# Altium schematic sheet Schematic1_4.SchDoc
size 594 x 420 mm; SchematicName: Schematic1; PageName: 4; CmpIndex: 977; Symbol name: A2-LIST-2N-1-GA.1; SymIndex: 3
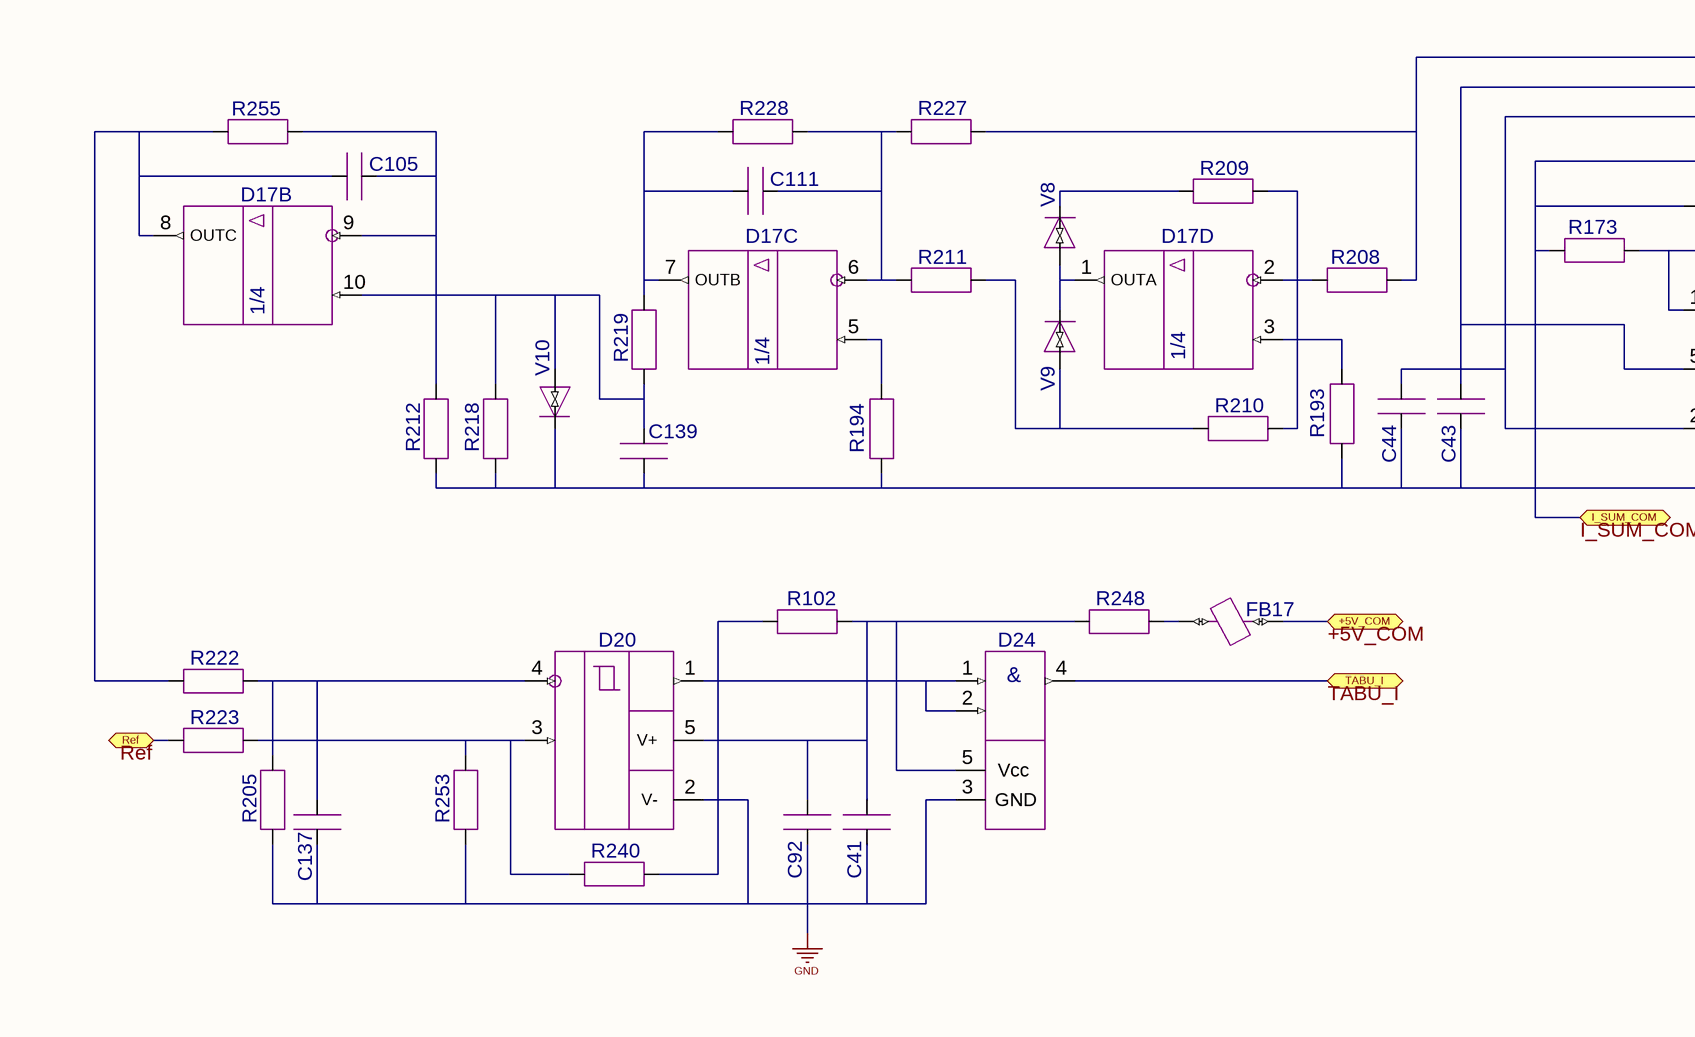
[diagram p0: Schematic1_4.SchDoc, top left]
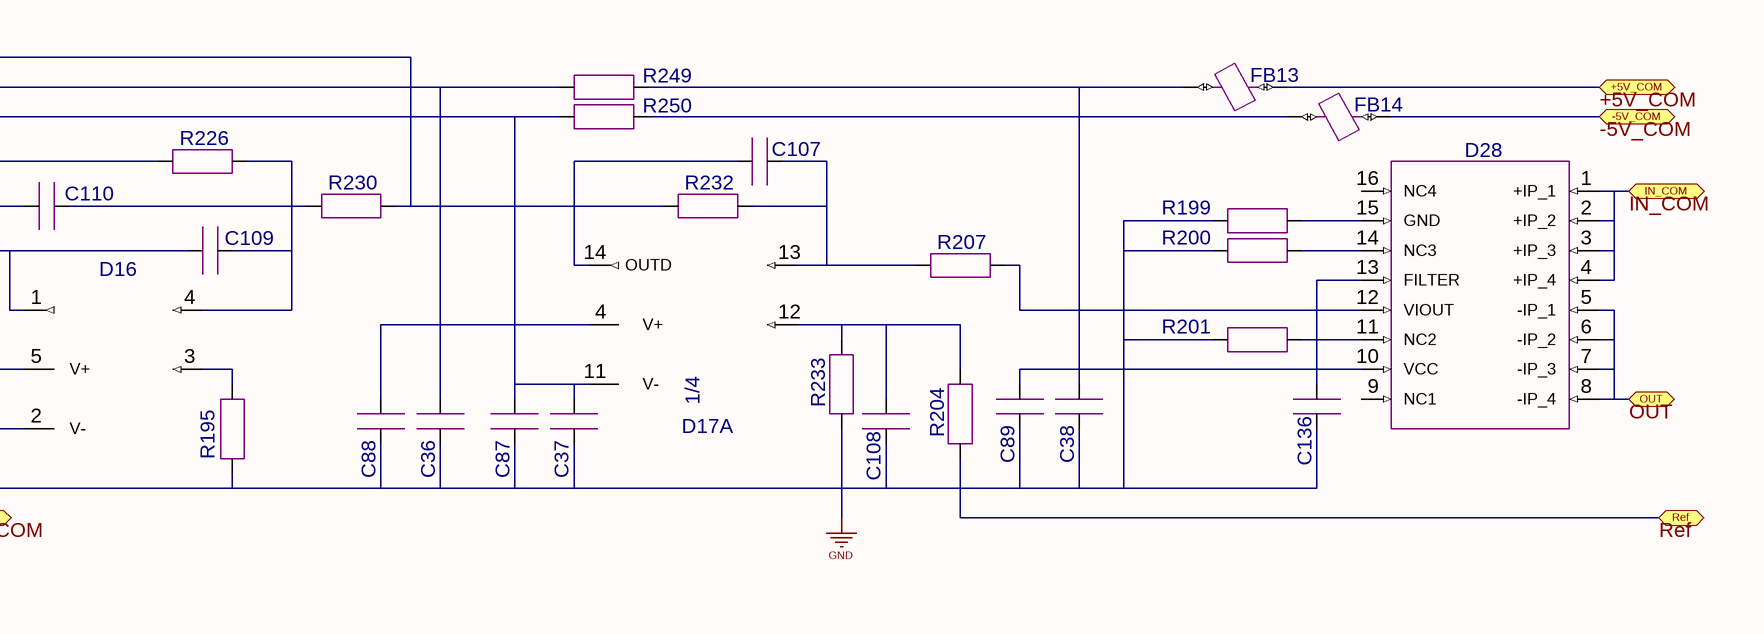
[diagram p1: Schematic1_4.SchDoc, top right]
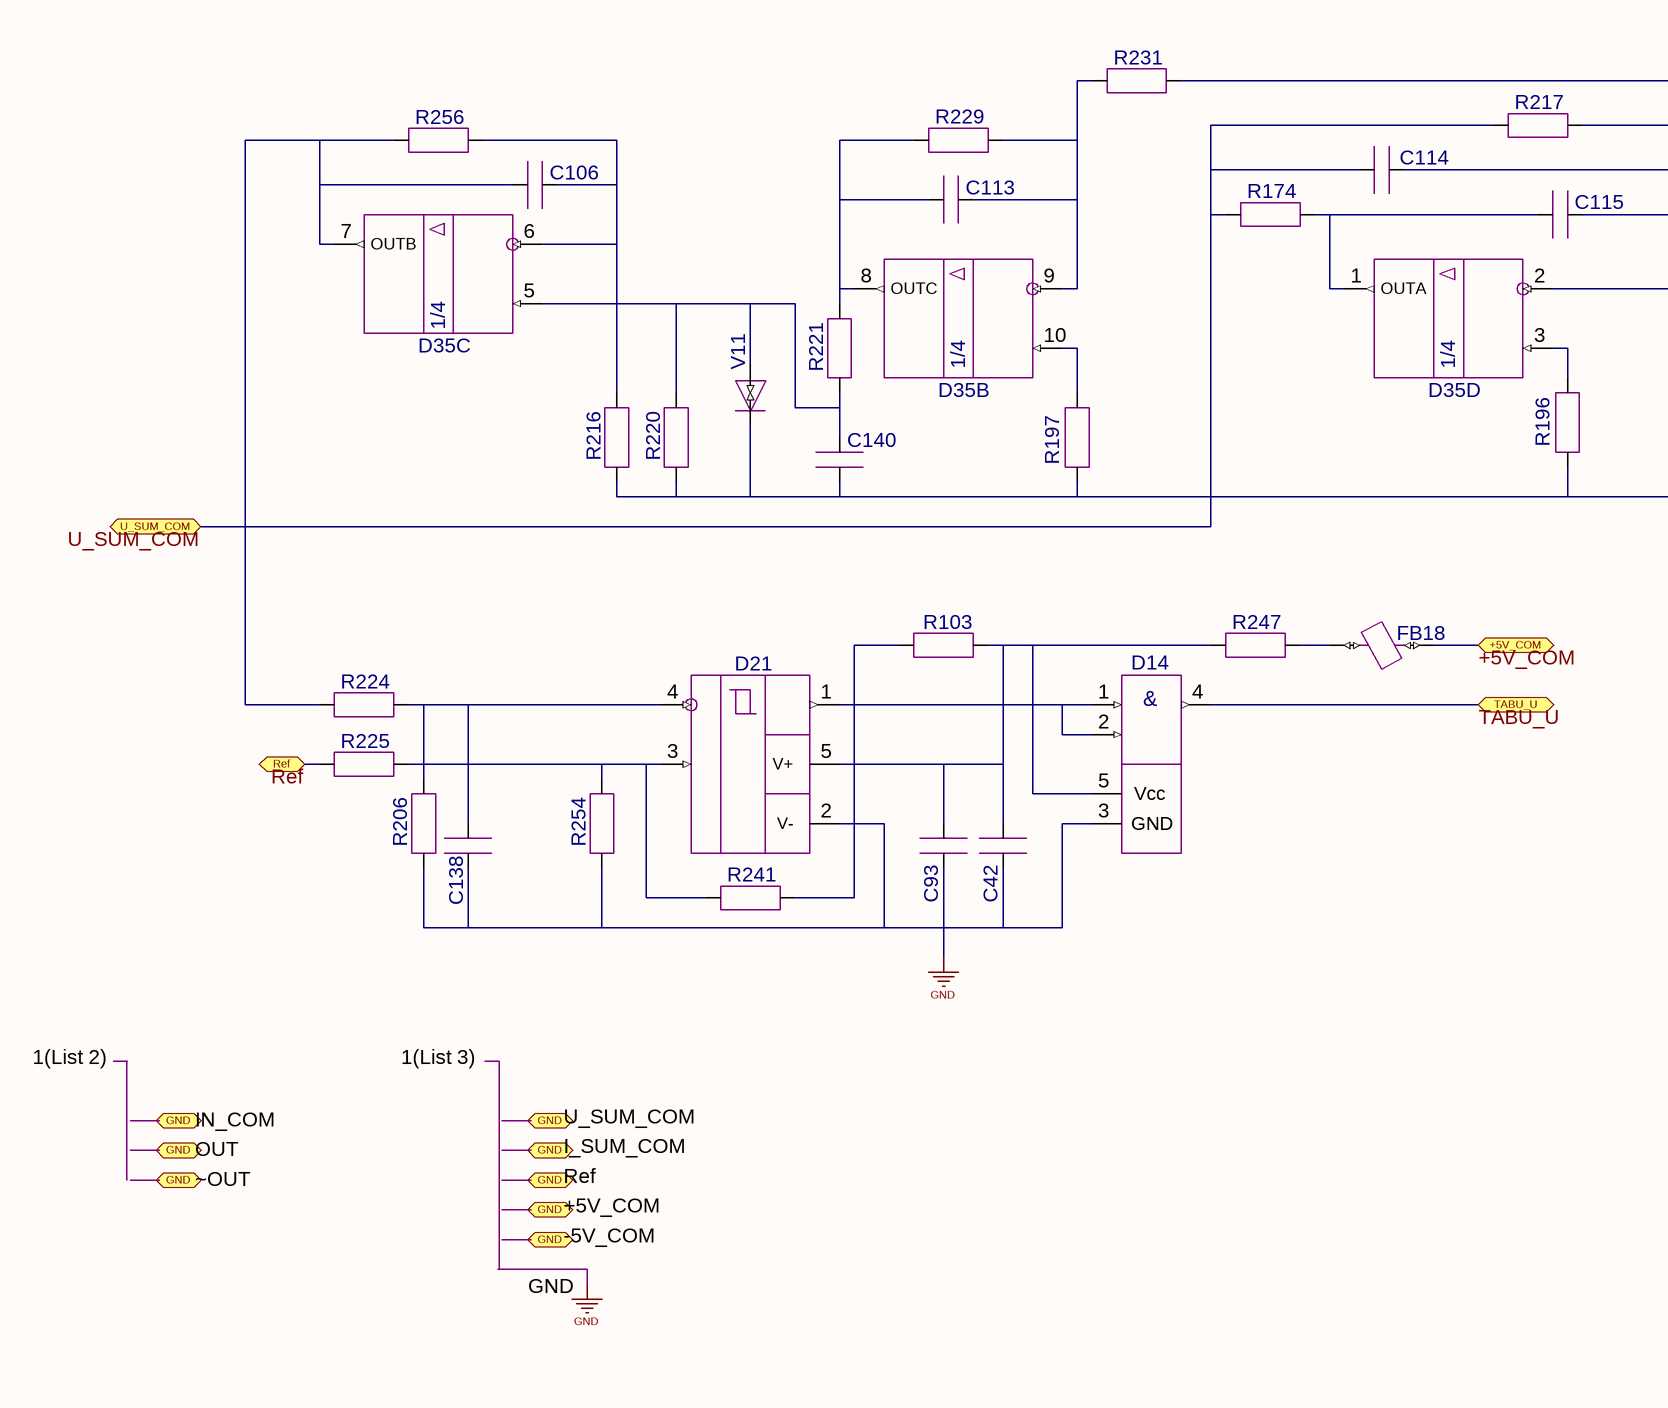
[diagram p2: Schematic1_4.SchDoc, bottom left]
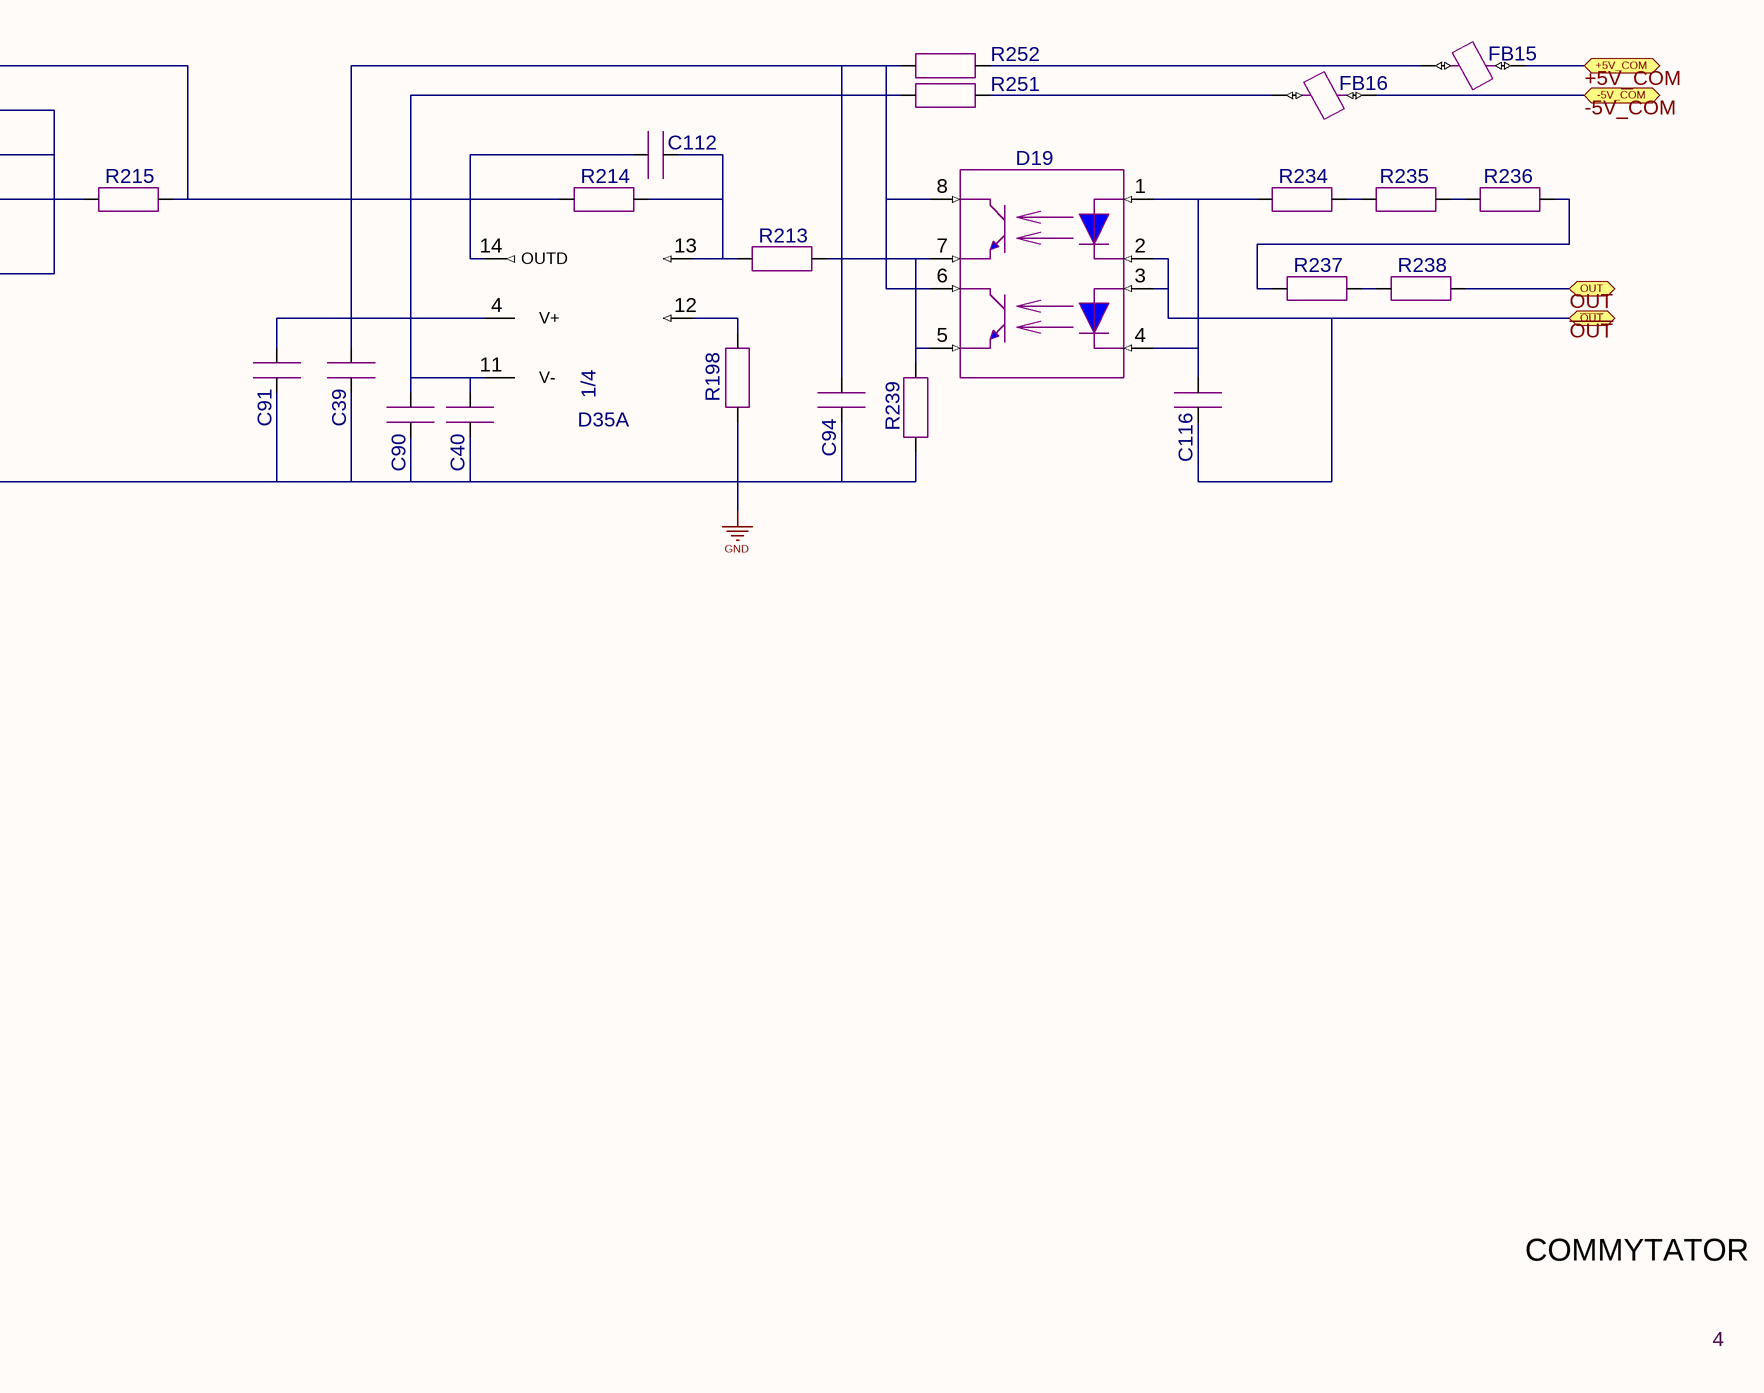
[diagram p3: Schematic1_4.SchDoc, bottom right]

## Parts
C36  CAP CER 0.1UF 50V 10% X7R 0603  (value not drawn)
C37  CAP CER 0.1UF 50V 10% X7R 0603  (value not drawn)
C38  CAP CER 0.1UF 50V 10% X7R 0603  (value not drawn)
C39  CAP CER 0.1UF 50V 10% X7R 0603  (value not drawn)
C40  CAP CER 0.1UF 50V 10% X7R 0603  (value not drawn)
C41  CAP CER 0.1UF 50V 10% X7R 0603  (value not drawn)
C42  CAP CER 0.1UF 50V 10% X7R 0603  (value not drawn)
C43  CAP CER 0.1UF 50V 10% X7R 0603  (value not drawn)
C44  CAP CER 0.1UF 50V 10% X7R 0603  (value not drawn)
C87  CAP CER 10UF 16V 10% X7R 0805  (value not drawn)
C88  CAP CER 10UF 16V 10% X7R 0805  (value not drawn)
C89  CAP CER 10UF 16V 10% X7R 0805  (value not drawn)
C90  CAP CER 10UF 16V 10% X7R 0805  (value not drawn)
C91  CAP CER 10UF 16V 10% X7R 0805  (value not drawn)
C92  CAP CER 10UF 16V 10% X7R 0805  (value not drawn)
C93  CAP CER 10UF 16V 10% X7R 0805  (value not drawn)
C94  CAP CER 10UF 16V 10% X7R 0805  (value not drawn)
C105  CAP CER 10PF 50V 5% NP0 0603  (value not drawn)
C106  CAP CER 10PF 50V 5% NP0 0603  (value not drawn)
C107  CAP CER 1PF 50V C0G/NP0 0603  (value not drawn)
C108  CAP CER 1PF 50V C0G/NP0 0603  (value not drawn)
C109  CAP CER 1PF 50V C0G/NP0 0603  (value not drawn)
C110  CAP CER 1PF 50V C0G/NP0 0603  (value not drawn)
C111  CAP CER 1PF 50V C0G/NP0 0603  (value not drawn)
C112  CAP CER 1PF 50V C0G/NP0 0603  (value not drawn)
C113  CAP CER 1PF 50V C0G/NP0 0603  (value not drawn)
C114  CAP CER 1PF 50V C0G/NP0 0603  (value not drawn)
C115  CAP CER 1PF 50V C0G/NP0 0603  (value not drawn)
C116  CAP CER 1PF 50V C0G/NP0 0603  (value not drawn)
C136  CAP CER 1000PF 50V 5% NP0 0603  (value not drawn)
C137  CAP CER 1000PF 50V 5% NP0 0603  (value not drawn)
C138  CAP CER 1000PF 50V 5% NP0 0603  (value not drawn)
C139  CAP CER 8200PF 50V 10% X7R 0805  (value not drawn)
C140  CAP CER 8200PF 50V 10% X7R 0805  (value not drawn)
D14  IC GATE AND 1CH 2-INP SOT-23-5  (value not drawn)
D16  IC OPAMP VFB 130MHZ RRO SOT23-5  (value not drawn)
D17  IC OPAMP VFB 130MHZ RRO 14SOIC  (value not drawn)  (parts A,B,C,D of 4)
D19  OPTOISO 2.5KV 2CH TRANS 8SOIC  (value not drawn)
D20  IC COMPARATR NANOPWR P-P SOT23-5  (value not drawn)
D21  IC COMPARATR NANOPWR P-P SOT23-5  (value not drawn)
D24  IC GATE NAND 1CH 2-INP SOT-23-5  (value not drawn)
D28  HALL EFFECT CURRENT SENSRO  (value not drawn)
D35  IC OPAMP VFB 130MHZ RRO 14SOIC  (value not drawn)  (parts A,B,C,D of 4)
FB13  FERRITE BEAD 1800 OHM 0,2 A 0603  (value not drawn)
FB14  FERRITE BEAD 1800 OHM 0,2 A 0603  (value not drawn)
FB15  FERRITE BEAD 1800 OHM 0,2 A 0603  (value not drawn)
FB16  FERRITE BEAD 1800 OHM 0,2 A 0603  (value not drawn)
FB17  FERRITE BEAD 1800 OHM 0,2 A 0603  (value not drawn)
FB18  FERRITE BEAD 1800 OHM 0,2 A 0603  (value not drawn)
R102  RES 4.70K OHM 1/10W 1% 0603 SMD  (value not drawn)
R103  RES 4.70K OHM 1/10W 1% 0603 SMD  (value not drawn)
R173  RES 200 OHM 1/10W 1% 0603 SMD  (value not drawn)
R174  RES 200 OHM 1/10W 1% 0603 SMD  (value not drawn)
R193  RES 0.0 OHM 1/10W 0603 SMD  (value not drawn)
R194  RES 0.0 OHM 1/10W 0603 SMD  (value not drawn)
R195  RES 0.0 OHM 1/10W 0603 SMD  (value not drawn)
R196  RES 0.0 OHM 1/10W 0603 SMD  (value not drawn)
R197  RES 0.0 OHM 1/10W 0603 SMD  (value not drawn)
R198  RES 0.0 OHM 1/10W 0603 SMD  (value not drawn)
R199  RES 0.0 OHM 1/10W 0603 SMD  (value not drawn)
R200  RES 0.0 OHM 1/10W 0603 SMD  (value not drawn)
R201  RES 0.0 OHM 1/10W 0603 SMD  (value not drawn)
R204  RES 10.7 OHM 1/10W 1% 0603 SMD  (value not drawn)
R205  RES 10.7 OHM 1/10W 1% 0603 SMD  (value not drawn)
R206  RES 10.7 OHM 1/10W 1% 0603 SMD  (value not drawn)
R207  RES 10.2K OHM 1/10W 1% 0603 SMD  (value not drawn)
R208  RES 10.2K OHM 1/10W 1% 0603 SMD  (value not drawn)
R209  RES 10.2K OHM 1/10W 1% 0603 SMD  (value not drawn)
R210  RES 10.2K OHM 1/10W 1% 0603 SMD  (value not drawn)
R211  RES 10.2K OHM 1/10W 1% 0603 SMD  (value not drawn)
R212  RES 10.2K OHM 1/10W 1% 0603 SMD  (value not drawn)
R213  RES 10.2K OHM 1/10W 1% 0603 SMD  (value not drawn)
R214  RES 10.2K OHM 1/10W 1% 0603 SMD  (value not drawn)
R215  RES 10.2K OHM 1/10W 1% 0603 SMD  (value not drawn)
R216  RES 10.2K OHM 1/10W 1% 0603 SMD  (value not drawn)
R217  RES 10.2K OHM 1/10W 1% 0603 SMD  (value not drawn)
R218  RES 10.2K OHM 1/10W 1% 0603 SMD  (value not drawn)
R219  RES 10.2K OHM 1/10W 1% 0603 SMD  (value not drawn)
R220  RES 10.2K OHM 1/10W 1% 0603 SMD  (value not drawn)
R221  RES 10.2K OHM 1/10W 1% 0603 SMD  (value not drawn)
R222  RES 10.2K OHM 1/10W 1% 0603 SMD  (value not drawn)
R223  RES 10.2K OHM 1/10W 1% 0603 SMD  (value not drawn)
R224  RES 10.2K OHM 1/10W 1% 0603 SMD  (value not drawn)
R225  RES 10.2K OHM 1/10W 1% 0603 SMD  (value not drawn)
R226  RES 20.5K OHM 1/10W 1% 0603 SMD  (value not drawn)
R227  RES 20.5K OHM 1/10W 1% 0603 SMD  (value not drawn)
R228  RES 20.5K OHM 1/10W 1% 0603 SMD  (value not drawn)
R229  RES 20.5K OHM 1/10W 1% 0603 SMD  (value not drawn)
R230  RES 20.5K OHM 1/10W 1% 0603 SMD  (value not drawn)
R231  RES 20.5K OHM 1/10W 1% 0603 SMD  (value not drawn)
R232  RES 20.5K OHM 1/10W 1% 0603 SMD  (value not drawn)
R233  RES 20.5K OHM 1/10W 1% 0603 SMD  (value not drawn)
R234  RES 22.0K OHM 1W 5% 2512 SMD  (value not drawn)
R235  RES 22.0K OHM 1W 5% 2512 SMD  (value not drawn)
R236  RES 22.0K OHM 1W 5% 2512 SMD  (value not drawn)
R237  RES 22.0K OHM 1W 5% 2512 SMD  (value not drawn)
R238  RES 22.0K OHM 1W 5% 2512 SMD  (value not drawn)
R239  RES 51.1 OHM 1/2W 1% 1210 SMD  (value not drawn)
R240  RES 340K OHM 1/10W 1% 0603 SMD  (value not drawn)
R241  RES 340K OHM 1/10W 1% 0603 SMD  (value not drawn)
R247  RES 10.0 OHM 1/10W 1% 0603 SMD  (value not drawn)
R248  RES 10.0 OHM 1/10W 1% 0603 SMD  (value not drawn)
R249  RES 10.0 OHM 1/10W 1% 0603 SMD  (value not drawn)
R250  RES 10.0 OHM 1/10W 1% 0603 SMD  (value not drawn)
R251  RES 10.0 OHM 1/10W 1% 0603 SMD  (value not drawn)
R252  RES 10.0 OHM 1/10W 1% 0603 SMD  (value not drawn)
R253  RES 210 OHM 1/10W 1% 0603 SMD  (value not drawn)
R254  RES 210 OHM 1/10W 1% 0603 SMD  (value not drawn)
R255  RES 53.6K OHM 1/10W 1% 0603 SMD  (value not drawn)
R256  RES 53.6K OHM 1/10W 1% 0603 SMD  (value not drawn)
V8  DIODE SWITCH 100V 0.15A SOD123  (value not drawn)
V9  DIODE SWITCH 100V 0.15A SOD123  (value not drawn)
V10  DIODE SWITCH 100V 0.15A SOD123  (value not drawn)
V11  DIODE SWITCH 100V 0.15A SOD123  (value not drawn)

## Ports
+5V_COM, -5V_COM, GND, I_SUM_COM, IN_COM, OUT, Ref, TABU_I, TABU_U, U_SUM_COM, ~{OUT}

## Nets
GND: C36.1 C37.1 C38.1 C39.1 C40.1 C41.1 C42.1 C43.1 C44.1 C87.2 C88.2 C89.2 C90.2 C91.2 C92.2 C93.2 C94.2 C108.1 C136.2 C137.2 C138.2 C139.1 C140.1 D14.3(GND) D20.2(V-) D21.2(V-) D24.3(GND) R193.2 R194.2 R195.2 R196.2 R197.2 R198.2 R199.2 R200.2 R201.2 R205.1 R206.1 R212.1 R216.1 R218.1 R220.1 R233.1 R239.1 R253.1 R254.1 V10.1(C) V11.1(C)
+5V_COM: FB13.1 FB15.1 FB17.1 FB18.1 ; port +5V_COM
-5V_COM: FB14.1 FB16.1 ; port -5V_COM
I_SUM_COM: C110.2 R173.1 R226.1 ; port I_SUM_COM
IN_COM: D28.1(+IP_1) D28.2(+IP_2) D28.3(+IP_3) D28.4(+IP_4) ; port IN_COM
~{OUT}: C116.2 D19.2(C1) D19.3(A2) ; port ~{OUT}
OUT: D28.5(-IP_1) D28.6(-IP_2) D28.7(-IP_3) D28.8(-IP_4) R238.2 ; port OUT
Ref: R204.1 R223.1 R225.1 ; port Ref
TABU_I: D24.4(Y) ; port TABU_I
TABU_U: D14.4(Y) ; port TABU_U
U_SUM_COM: C114.2 R174.1 R217.1 ; port U_SUM_COM
NetC36_2: C36.2 C43.2 C88.1 D16.5(V+) D17.4(V+) R249.1
NetC37_2: C37.2 C44.2 C87.1 D16.2(V-) D17.11(V-) R250.1
NetC38_2: C38.2 C89.1 D28.10(VCC) FB13.2 R249.2
NetC39_2: C39.2 C91.1 C94.1 D19.6(C3) D19.8(C4) D35.4(V+) R252.1
NetC40_2: C40.2 C90.1 D35.11(V-) R251.1
NetC41_2: C41.2 C92.1 D20.5(V+) D24.5(Vcc) R102.2 R248.1
NetC42_2: C42.2 C93.1 D14.5(Vcc) D21.5(V+) R103.2 R247.1
NetC105_1: C105.1 D17.9(-INC) R212.2 R255.2
NetC105_2: C105.2 D17.8(OUTC) R222.1 R255.1
NetC106_1: C106.1 D35.6(-INB) R216.2 R256.2
NetC106_2: C106.2 D35.7(OUTB) R224.1 R256.1
NetC107_1: C107.1 D17.13(-IND) R207.1 R232.2
NetC107_2: C107.2 D17.14(OUTD) R208.2 R227.2 R230.2 R232.1
NetC108_2: C108.2 D17.12(+IND) R204.2 R233.2
NetC109_1: C109.1 C110.1 D16.4(-IN) R226.2 R230.1
NetC109_2: C109.2 D16.1(OUT) R173.2
NetC111_1: C111.1 D17.6(-INB) R211.1 R227.1 R228.2
NetC111_2: C111.2 D17.7(OUTB) R219.2 R228.1
NetC112_1: C112.1 D35.13(-IND) R213.1 R214.2
NetC112_2: C112.2 D35.14(OUTD) R214.1 R215.2 R231.2
NetC113_1: C113.1 D35.9(-INC) R229.2 R231.1
NetC113_2: C113.2 D35.8(OUTC) R221.2 R229.1
NetC114_1: C114.1 C115.1 D35.2(-INA) R215.1 R217.2
NetC115_2: C115.2 D35.1(OUTA) R174.2
NetC116_1: C116.1 D19.1(A1) D19.4(C2) R234.1
NetC136_1: C136.1 D28.13(FILTER)
NetC137_1: C137.1 D20.4(-IN) R205.2 R222.2
NetC138_1: C138.1 D21.4(-IN) R206.2 R224.2
NetC139_2: C139.2 D17.10(+INC) R218.2 R219.1 V10.2(A)
NetC140_2: C140.2 D35.5(+INB) R220.2 R221.1 V11.2(A)
NetD14_1: D14.1(A) D14.2(B) D21.1(OUT) R103.1 R241.2
NetD16_3: D16.3(+IN) R195.1
NetD17_1: D17.1(OUTA) V8.2(A) V9.1(C)
NetD17_2: D17.2(-INA) R208.1 R209.2 R210.2
NetD17_3: D17.3(+INA) R193.1
NetD17_5: D17.5(+INB) R194.1
NetD19_5: D19.5(A3) D19.7(A4) R213.2 R239.2
NetD20_1: D20.1(OUT) D24.1(A) D24.2(B) R102.1 R240.2
NetD20_3: D20.3(+IN) R223.2 R240.1 R253.2
NetD21_3: D21.3(+IN) R225.2 R241.1 R254.2
NetD28_11: D28.11(NC2) R201.1
NetD28_12: D28.12(VIOUT) R207.2
NetD28_14: D28.14(NC3) R200.1
NetD28_15: D28.15(GND) R199.1
NetD35_3: D35.3(+INA) R196.1
NetD35_10: D35.10(+INC) R197.1
NetD35_12: D35.12(+IND) R198.1
NetFB14_2: FB14.2 R250.2
NetFB15_2: FB15.2 R252.2
NetFB16_2: FB16.2 R251.2
NetFB17_2: FB17.2 R248.2
NetFB18_2: FB18.2 R247.2
NetR209_1: R209.1 V8.1(C)
NetR210_1: R210.1 R211.2 V9.2(A)
NetR234_2: R234.2 R235.1
NetR235_2: R235.2 R236.1
NetR236_2: R236.2 R237.1
NetR237_2: R237.2 R238.1

Not connected (* = marked no-connect by the designer): D28 9(NC1) 16(NC4)

## Notes on the sheet
- 1(List 2)
- 1(List 3)
- IN_COM
- U_SUM_COM
- OUT
- ~OUT
- +5V_COM
- I_SUM_COM
- Ref
- GND
- -5V_COM
- COMMYTATOR
- 4
- Labels drawn without touching a wire or pin: GND
- (in symbol IC GATE AND 1CH 2-INP SOT-23-5) &
- (in symbol IC GATE NAND 1CH 2-INP SOT-23-5) &
- (in symbol IC OPAMP VFB 130MHZ RRO 14SOIC, part A) 1/4
- (in symbol IC OPAMP VFB 130MHZ RRO 14SOIC, part B) 1/4
- (in symbol IC OPAMP VFB 130MHZ RRO 14SOIC, part C) 1/4
- (in symbol IC OPAMP VFB 130MHZ RRO 14SOIC, part D) 1/4

## Library data of the parts
C36 = CAP CER 0.1UF 50V 10% X7R 0603: CL10B104KB8SFNC; Part Label: 100nF VIP; Cell Name: 0603-STANDART-1608; CmpIndex: 285; Ref Designator: C36; Symbol name: C-SXEM-1.1; SymIndex: 6; Part Name: CAP CER 0.1UF 50V 10% X7R 0603; Part Number: CL10B104KB8SFNC
C37 = CAP CER 0.1UF 50V 10% X7R 0603: CL10B104KB8SFNC; Part Label: 100nF VIP; Cell Name: 0603-STANDART-1608; CmpIndex: 286; Ref Designator: C37; Symbol name: C-SXEM-1.1; SymIndex: 6; Part Name: CAP CER 0.1UF 50V 10% X7R 0603; Part Number: CL10B104KB8SFNC
C38 = CAP CER 0.1UF 50V 10% X7R 0603: CL10B104KB8SFNC; Part Label: 100nF VIP; Cell Name: 0603-STANDART-1608; CmpIndex: 289; Ref Designator: C38; Symbol name: C-SXEM-1.1; SymIndex: 6; Part Name: CAP CER 0.1UF 50V 10% X7R 0603; Part Number: CL10B104KB8SFNC
C39 = CAP CER 0.1UF 50V 10% X7R 0603: CL10B104KB8SFNC; Part Label: 100nF VIP; Cell Name: 0603-STANDART-1608; CmpIndex: 335; Ref Designator: C39; Symbol name: C-SXEM-1.1; SymIndex: 6; Part Name: CAP CER 0.1UF 50V 10% X7R 0603; Part Number: CL10B104KB8SFNC
C40 = CAP CER 0.1UF 50V 10% X7R 0603: CL10B104KB8SFNC; Part Label: 100nF VIP; Cell Name: 0603-STANDART-1608; CmpIndex: 336; Ref Designator: C40; Symbol name: C-SXEM-1.1; SymIndex: 6; Part Name: CAP CER 0.1UF 50V 10% X7R 0603; Part Number: CL10B104KB8SFNC
C41 = CAP CER 0.1UF 50V 10% X7R 0603: CL10B104KB8SFNC; Part Label: 100nF VIP; Cell Name: 0603-STANDART-1608; CmpIndex: 384; Ref Designator: C41; Symbol name: C-SXEM-1.1; SymIndex: 6; Part Name: CAP CER 0.1UF 50V 10% X7R 0603; Part Number: CL10B104KB8SFNC
C42 = CAP CER 0.1UF 50V 10% X7R 0603: CL10B104KB8SFNC; Part Label: 100nF VIP; Cell Name: 0603-STANDART-1608; CmpIndex: 395; Ref Designator: C42; Symbol name: C-SXEM-1.1; SymIndex: 6; Part Name: CAP CER 0.1UF 50V 10% X7R 0603; Part Number: CL10B104KB8SFNC
C43 = CAP CER 0.1UF 50V 10% X7R 0603: CL10B104KB8SFNC; Part Label: 100nF VIP; Cell Name: 0603-STANDART-1608; CmpIndex: 307; Ref Designator: C43; Symbol name: C-SXEM-1.1; SymIndex: 6; Part Name: CAP CER 0.1UF 50V 10% X7R 0603; Part Number: CL10B104KB8SFNC
C44 = CAP CER 0.1UF 50V 10% X7R 0603: CL10B104KB8SFNC; Part Label: 100nF VIP; Cell Name: 0603-STANDART-1608; CmpIndex: 332; Ref Designator: C44; Symbol name: C-SXEM-1.1; SymIndex: 6; Part Name: CAP CER 0.1UF 50V 10% X7R 0603; Part Number: CL10B104KB8SFNC
C87 = CAP CER 10UF 16V 10% X7R 0805: CL21B106KOQNNNE; Part Label: 10uF VIP; Cell Name: 0805-STANDART-2012; CmpIndex: 287; Ref Designator: C87; Symbol name: C-SXEM-1.1; SymIndex: 6; Part Name: CAP CER 10UF 16V 10% X7R 0805; Part Number: CL21B106KOQNNNE
C88 = CAP CER 10UF 16V 10% X7R 0805: CL21B106KOQNNNE; Part Label: 10uF VIP; Cell Name: 0805-STANDART-2012; CmpIndex: 288; Ref Designator: C88; Symbol name: C-SXEM-1.1; SymIndex: 6; Part Name: CAP CER 10UF 16V 10% X7R 0805; Part Number: CL21B106KOQNNNE
C89 = CAP CER 10UF 16V 10% X7R 0805: CL21B106KOQNNNE; Part Label: 10uF VIP; Cell Name: 0805-STANDART-2012; CmpIndex: 290; Ref Designator: C89; Symbol name: C-SXEM-1.1; SymIndex: 6; Part Name: CAP CER 10UF 16V 10% X7R 0805; Part Number: CL21B106KOQNNNE
C90 = CAP CER 10UF 16V 10% X7R 0805: CL21B106KOQNNNE; Part Label: 10uF VIP; Cell Name: 0805-STANDART-2012; CmpIndex: 337; Ref Designator: C90; Symbol name: C-SXEM-1.1; SymIndex: 6; Part Name: CAP CER 10UF 16V 10% X7R 0805; Part Number: CL21B106KOQNNNE
C91 = CAP CER 10UF 16V 10% X7R 0805: CL21B106KOQNNNE; Part Label: 10uF VIP; Cell Name: 0805-STANDART-2012; CmpIndex: 338; Ref Designator: C91; Symbol name: C-SXEM-1.1; SymIndex: 6; Part Name: CAP CER 10UF 16V 10% X7R 0805; Part Number: CL21B106KOQNNNE
C92 = CAP CER 10UF 16V 10% X7R 0805: CL21B106KOQNNNE; Part Label: 10uF VIP; Cell Name: 0805-STANDART-2012; CmpIndex: 385; Ref Designator: C92; Symbol name: C-SXEM-1.1; SymIndex: 6; Part Name: CAP CER 10UF 16V 10% X7R 0805; Part Number: CL21B106KOQNNNE
C93 = CAP CER 10UF 16V 10% X7R 0805: CL21B106KOQNNNE; Part Label: 10uF VIP; Cell Name: 0805-STANDART-2012; CmpIndex: 396; Ref Designator: C93; Symbol name: C-SXEM-1.1; SymIndex: 6; Part Name: CAP CER 10UF 16V 10% X7R 0805; Part Number: CL21B106KOQNNNE
C94 = CAP CER 10UF 16V 10% X7R 0805: CL21B106KOQNNNE; Part Label: 10uF VIP; Cell Name: 0805-STANDART-2012; CmpIndex: 133; Ref Designator: C94; Symbol name: C-SXEM-1.1; SymIndex: 6; Part Name: CAP CER 10UF 16V 10% X7R 0805; Part Number: CL21B106KOQNNNE
C105 = CAP CER 10PF 50V 5% NP0 0603: GRM1885C1H100JA01D; Cell Name: 0603-STANDART-1608; CmpIndex: 297; Ref Designator: C105; Symbol name: C-SXEM-1.1; SymIndex: 6; Part Label: 10pF; Part Name: CAP CER 10PF 50V 5% NP0 0603; Part Number: GRM1885C1H100JA01D
C106 = CAP CER 10PF 50V 5% NP0 0603: GRM1885C1H100JA01D; Cell Name: 0603-STANDART-1608; CmpIndex: 343; Ref Designator: C106; Symbol name: C-SXEM-1.1; SymIndex: 6; Part Label: 10pF; Part Name: CAP CER 10PF 50V 5% NP0 0603; Part Number: GRM1885C1H100JA01D
C107 = CAP CER 1PF 50V C0G/NP0 0603: CL10C010BB8NNNC; Cell Name: 0603-STANDART-1608; CmpIndex: 299; Ref Designator: C107; Symbol name: C-SXEM-1.1; SymIndex: 6; Part Label: 1pF; Part Name: CAP CER 1PF 50V C0G/NP0 0603; Part Number: CL10C010BB8NNNC
C108 = CAP CER 1PF 50V C0G/NP0 0603: CL10C010BB8NNNC; Cell Name: 0603-STANDART-1608; CmpIndex: 300; Ref Designator: C108; Symbol name: C-SXEM-1.1; SymIndex: 6; Part Label: 1pF; Part Name: CAP CER 1PF 50V C0G/NP0 0603; Part Number: CL10C010BB8NNNC
C109 = CAP CER 1PF 50V C0G/NP0 0603: CL10C010BB8NNNC; Cell Name: 0603-STANDART-1608; CmpIndex: 301; Ref Designator: C109; Symbol name: C-SXEM-1.1; SymIndex: 6; Part Label: 1pF; Part Name: CAP CER 1PF 50V C0G/NP0 0603; Part Number: CL10C010BB8NNNC
C110 = CAP CER 1PF 50V C0G/NP0 0603: CL10C010BB8NNNC; Cell Name: 0603-STANDART-1608; CmpIndex: 302; Ref Designator: C110; Symbol name: C-SXEM-1.1; SymIndex: 6; Part Label: 1pF; Part Name: CAP CER 1PF 50V C0G/NP0 0603; Part Number: CL10C010BB8NNNC
C111 = CAP CER 1PF 50V C0G/NP0 0603: CL10C010BB8NNNC; Cell Name: 0603-STANDART-1608; CmpIndex: 303; Ref Designator: C111; Symbol name: C-SXEM-1.1; SymIndex: 6; Part Label: 1pF; Part Name: CAP CER 1PF 50V C0G/NP0 0603; Part Number: CL10C010BB8NNNC
C112 = CAP CER 1PF 50V C0G/NP0 0603: CL10C010BB8NNNC; Cell Name: 0603-STANDART-1608; CmpIndex: 344; Ref Designator: C112; Symbol name: C-SXEM-1.1; SymIndex: 6; Part Label: 1pF; Part Name: CAP CER 1PF 50V C0G/NP0 0603; Part Number: CL10C010BB8NNNC
C113 = CAP CER 1PF 50V C0G/NP0 0603: CL10C010BB8NNNC; Cell Name: 0603-STANDART-1608; CmpIndex: 345; Ref Designator: C113; Symbol name: C-SXEM-1.1; SymIndex: 6; Part Label: 1pF; Part Name: CAP CER 1PF 50V C0G/NP0 0603; Part Number: CL10C010BB8NNNC
C114 = CAP CER 1PF 50V C0G/NP0 0603: CL10C010BB8NNNC; Cell Name: 0603-STANDART-1608; CmpIndex: 370; Ref Designator: C114; Symbol name: C-SXEM-1.1; SymIndex: 6; Part Label: 1pF; Part Name: CAP CER 1PF 50V C0G/NP0 0603; Part Number: CL10C010BB8NNNC
C115 = CAP CER 1PF 50V C0G/NP0 0603: CL10C010BB8NNNC; Cell Name: 0603-STANDART-1608; CmpIndex: 371; Ref Designator: C115; Symbol name: C-SXEM-1.1; SymIndex: 6; Part Label: 1pF; Part Name: CAP CER 1PF 50V C0G/NP0 0603; Part Number: CL10C010BB8NNNC
C116 = CAP CER 1PF 50V C0G/NP0 0603: CL10C010BB8NNNC; Cell Name: 0603-STANDART-1608; CmpIndex: 424; Ref Designator: C116; Symbol name: C-SXEM-1.1; SymIndex: 6; Part Label: 1pF; Part Name: CAP CER 1PF 50V C0G/NP0 0603; Part Number: CL10C010BB8NNNC
C136 = CAP CER 1000PF 50V 5% NP0 0603: GRM1885C1H102JA01D; Part Label: 1nF; Cell Name: 0603-STANDART-1608; CmpIndex: 334; Ref Designator: C136; Symbol name: C-SXEM-1.1; SymIndex: 6; Part Name: CAP CER 1000PF 50V 5% NP0 0603; Part Number: GRM1885C1H102JA01D
C137 = CAP CER 1000PF 50V 5% NP0 0603: GRM1885C1H102JA01D; Part Label: 1nF; Cell Name: 0603-STANDART-1608; CmpIndex: 392; Ref Designator: C137; Symbol name: C-SXEM-1.1; SymIndex: 6; Part Name: CAP CER 1000PF 50V 5% NP0 0603; Part Number: GRM1885C1H102JA01D
C138 = CAP CER 1000PF 50V 5% NP0 0603: GRM1885C1H102JA01D; Part Label: 1nF; Cell Name: 0603-STANDART-1608; CmpIndex: 403; Ref Designator: C138; Symbol name: C-SXEM-1.1; SymIndex: 6; Part Name: CAP CER 1000PF 50V 5% NP0 0603; Part Number: GRM1885C1H102JA01D
C139 = CAP CER 8200PF 50V 10% X7R 0805: C0805C822K5RACTU; Part Label: 8.2nF; Cell Name: 0805-STANDART-2012; CmpIndex: 485; Ref Designator: C139; Symbol name: C-SXEM-1.1; SymIndex: 6; Part Name: CAP CER 8200PF 50V 10% X7R 0805; Part Number: C0805C822K5RACTU
C140 = CAP CER 8200PF 50V 10% X7R 0805: C0805C822K5RACTU; Part Label: 8.2nF; Cell Name: 0805-STANDART-2012; CmpIndex: 486; Ref Designator: C140; Symbol name: C-SXEM-1.1; SymIndex: 6; Part Name: CAP CER 8200PF 50V 10% X7R 0805; Part Number: C0805C822K5RACTU
D14 = IC GATE AND 1CH 2-INP SOT-23-5: SN74LVC1G08DBVR; Part Label: 5V/32mA; CmpIndex: 399; Ref Designator: D14; Symbol name: 1IN_AND_GATE.1; SymIndex: 60; Part Name: IC GATE AND 1CH 2-INP SOT-23-5; Part Number: SN74LVC1G08DBVR
D16 = IC OPAMP VFB 130MHZ RRO SOT23-5: LMH6642MF/NOPB; Cell Name: SOT-23-DBV-R-PDSO-G5-TI; CmpIndex: 321; Ref Designator: D16; Symbol name: SOT-23-5-ST-1.1; SymIndex: 43; Part Name: IC OPAMP VFB 130MHZ RRO SOT23-5; Part Number: LMH6642MF/NOPB
D17 = IC OPAMP VFB 130MHZ RRO 14SOIC: LMH6644MAX/NOPB; Cell Name: D_R_PDSO_G14; CmpIndex: 322; Ref Designator: D17; Symbol name: SOIC14_PART1-ST.1; SymIndex: 44; Orientation: 0;-1 = 0; Part Name: IC OPAMP VFB 130MHZ RRO 14SOIC; Part Number: LMH6644MAX/NOPB
D19 = OPTOISO 2.5KV 2CH TRANS 8SOIC: MOCD207R2M; Part Label: 2K; Cell Name: 8-SOIC-VISHAY; CmpIndex: 372; Ref Designator: D19; Symbol name: PS2501L-2.1; SymIndex: 24; Part Name: OPTOISO 2.5KV 2CH TRANS 8SOIC; Part Number: MOCD207R2M
D20 = IC COMPARATR NANOPWR P-P SOT23-5: TLV3701QDBVRG4Q1; Part Label: 2.7 V /16 V; Cell Name: SOT-23-DBV-R-PDSO-G5-TI; CmpIndex: 383; Ref Designator: D20; Symbol name: COMP-SOT-23-5-ST.1; SymIndex: 58; Part Name: IC COMPARATR NANOPWR P-P SOT23-5; Part Number: TLV3701QDBVRG4Q1
D21 = IC COMPARATR NANOPWR P-P SOT23-5: TLV3701QDBVRG4Q1; Part Label: 2.7 V /16 V; Cell Name: SOT-23-DBV-R-PDSO-G5-TI; CmpIndex: 394; Ref Designator: D21; Symbol name: COMP-SOT-23-5-ST.1; SymIndex: 58; Part Name: IC COMPARATR NANOPWR P-P SOT23-5; Part Number: TLV3701QDBVRG4Q1
D24 = IC GATE NAND 1CH 2-INP SOT-23-5: SN74AHCT1G00DBVR; Part Label: 5V/8mA; Cell Name: SOT-23-DBV-R-PDSO-G5-TI; CmpIndex: 388; Ref Designator: D24; Symbol name: 1IN_NAND_GATE.1; SymIndex: 59; Part Name: IC GATE NAND 1CH 2-INP SOT-23-5; Part Number: SN74AHCT1G00DBVR
D28 = HALL EFFECT CURRENT SENSRO: ACS724KMATR-65AB-T; Part Label: 65A/120kHZ/5V; CmpIndex: 443; Ref Designator: D28; Symbol name: ACS724KMA.1; SymIndex: 76; Part Name: HALL EFFECT CURRENT SENSRO; Part Number: ACS724KMATR-65AB-T
D35 = IC OPAMP VFB 130MHZ RRO 14SOIC: LMH6644MAX/NOPB_1; Cell Name: D_R_PDSO_G14; CmpIndex: 809; Ref Designator: D35; Symbol name: SOIC14_PART1-ST.1; SymIndex: 44; Orientation: 3;-3;-2 = 0; Part Name: IC OPAMP VFB 130MHZ RRO 14SOIC; Part Number: LMH6644MAX/NOPB_1
FB13 = FERRITE BEAD 1800 OHM 0,2 A 0603: MMZ1608A182B; Part Label: 1,8K/0,2A; Cell Name: 0603-STANDART-1608; CmpIndex: 291; Ref Designator: FB13; Symbol name: FERRITE-1.1; SymIndex: 10; Part Name: FERRITE BEAD 1800 OHM 0,2 A 0603; Part Number: MMZ1608A182B
FB14 = FERRITE BEAD 1800 OHM 0,2 A 0603: MMZ1608A182B; Part Label: 1,8K/0,2A; Cell Name: 0603-STANDART-1608; CmpIndex: 292; Ref Designator: FB14; Symbol name: FERRITE-1.1; SymIndex: 10; Part Name: FERRITE BEAD 1800 OHM 0,2 A 0603; Part Number: MMZ1608A182B
FB15 = FERRITE BEAD 1800 OHM 0,2 A 0603: MMZ1608A182B; Part Label: 1,8K/0,2A; Cell Name: 0603-STANDART-1608; CmpIndex: 339; Ref Designator: FB15; Symbol name: FERRITE-1.1; SymIndex: 10; Part Name: FERRITE BEAD 1800 OHM 0,2 A 0603; Part Number: MMZ1608A182B
FB16 = FERRITE BEAD 1800 OHM 0,2 A 0603: MMZ1608A182B; Part Label: 1,8K/0,2A; Cell Name: 0603-STANDART-1608; CmpIndex: 340; Ref Designator: FB16; Symbol name: FERRITE-1.1; SymIndex: 10; Part Name: FERRITE BEAD 1800 OHM 0,2 A 0603; Part Number: MMZ1608A182B
FB17 = FERRITE BEAD 1800 OHM 0,2 A 0603: MMZ1608A182B; Part Label: 1,8K/0,2A; Cell Name: 0603-STANDART-1608; CmpIndex: 390; Ref Designator: FB17; Symbol name: FERRITE-1.1; SymIndex: 10; Part Name: FERRITE BEAD 1800 OHM 0,2 A 0603; Part Number: MMZ1608A182B
FB18 = FERRITE BEAD 1800 OHM 0,2 A 0603: MMZ1608A182B; Part Label: 1,8K/0,2A; Cell Name: 0603-STANDART-1608; CmpIndex: 401; Ref Designator: FB18; Symbol name: FERRITE-1.1; SymIndex: 10; Part Name: FERRITE BEAD 1800 OHM 0,2 A 0603; Part Number: MMZ1608A182B
R102 = RES 4.70K OHM 1/10W 1% 0603 SMD: ERJ-3EKF4701V; Part Label: 4,7K; Cell Name: 0603-STANDART-1608; CmpIndex: 447; Ref Designator: R102; Symbol name: R-SXEM-1.1; SymIndex: 1; Part Name: RES 4.70K OHM 1/10W 1% 0603 SMD; Part Number: ERJ-3EKF4701V
R103 = RES 4.70K OHM 1/10W 1% 0603 SMD: ERJ-3EKF4701V; Part Label: 4,7K; Cell Name: 0603-STANDART-1608; CmpIndex: 448; Ref Designator: R103; Symbol name: R-SXEM-1.1; SymIndex: 1; Part Name: RES 4.70K OHM 1/10W 1% 0603 SMD; Part Number: ERJ-3EKF4701V
R173 = RES 200 OHM 1/10W 1% 0603 SMD: ERJ-3EKF2000V; Part Label: 200R; Cell Name: 0603-STANDART-1608; CmpIndex: 333; Ref Designator: R173; Symbol name: R-SXEM-1.1; SymIndex: 1; Part Name: RES 200 OHM 1/10W 1% 0603 SMD; Part Number: ERJ-3EKF2000V
R174 = RES 200 OHM 1/10W 1% 0603 SMD: ERJ-3EKF2000V; Part Label: 200R; Cell Name: 0603-STANDART-1608; CmpIndex: 369; Ref Designator: R174; Symbol name: R-SXEM-1.1; SymIndex: 1; Part Name: RES 200 OHM 1/10W 1% 0603 SMD; Part Number: ERJ-3EKF2000V
R193 = RES 0.0 OHM 1/10W 0603 SMD: ERJ-3GEY0R00V; Part Label: 0R; Cell Name: 0603-STANDART-1608; CmpIndex: 295; Ref Designator: R193; Symbol name: R-SXEM-1.1; SymIndex: 1; Part Name: RES 0.0 OHM 1/10W 0603 SMD; Part Number: ERJ-3GEY0R00V
R194 = RES 0.0 OHM 1/10W 0603 SMD: ERJ-3GEY0R00V; Part Label: 0R; Cell Name: 0603-STANDART-1608; CmpIndex: 296; Ref Designator: R194; Symbol name: R-SXEM-1.1; SymIndex: 1; Part Name: RES 0.0 OHM 1/10W 0603 SMD; Part Number: ERJ-3GEY0R00V
R195 = RES 0.0 OHM 1/10W 0603 SMD: ERJ-3GEY0R00V; Part Label: 0R; Cell Name: 0603-STANDART-1608; CmpIndex: 298; Ref Designator: R195; Symbol name: R-SXEM-1.1; SymIndex: 1; Part Name: RES 0.0 OHM 1/10W 0603 SMD; Part Number: ERJ-3GEY0R00V
R196 = RES 0.0 OHM 1/10W 0603 SMD: ERJ-3GEY0R00V; Part Label: 0R; Cell Name: 0603-STANDART-1608; CmpIndex: 341; Ref Designator: R196; Symbol name: R-SXEM-1.1; SymIndex: 1; Part Name: RES 0.0 OHM 1/10W 0603 SMD; Part Number: ERJ-3GEY0R00V
R197 = RES 0.0 OHM 1/10W 0603 SMD: ERJ-3GEY0R00V; Part Label: 0R; Cell Name: 0603-STANDART-1608; CmpIndex: 342; Ref Designator: R197; Symbol name: R-SXEM-1.1; SymIndex: 1; Part Name: RES 0.0 OHM 1/10W 0603 SMD; Part Number: ERJ-3GEY0R00V
R198 = RES 0.0 OHM 1/10W 0603 SMD: ERJ-3GEY0R00V; Part Label: 0R; Cell Name: 0603-STANDART-1608; CmpIndex: 381; Ref Designator: R198; Symbol name: R-SXEM-1.1; SymIndex: 1; Part Name: RES 0.0 OHM 1/10W 0603 SMD; Part Number: ERJ-3GEY0R00V
R199 = RES 0.0 OHM 1/10W 0603 SMD: ERJ-3GEY0R00V; Part Label: 0R; Cell Name: 0603-STANDART-1608; CmpIndex: 284; Ref Designator: R199; Symbol name: R-SXEM-1.1; SymIndex: 1; Part Name: RES 0.0 OHM 1/10W 0603 SMD; Part Number: ERJ-3GEY0R00V
R200 = RES 0.0 OHM 1/10W 0603 SMD: ERJ-3GEY0R00V; Part Label: 0R; Cell Name: 0603-STANDART-1608; CmpIndex: 444; Ref Designator: R200; Symbol name: R-SXEM-1.1; SymIndex: 1; Part Name: RES 0.0 OHM 1/10W 0603 SMD; Part Number: ERJ-3GEY0R00V
R201 = RES 0.0 OHM 1/10W 0603 SMD: ERJ-3GEY0R00V; Part Label: 0R; Cell Name: 0603-STANDART-1608; CmpIndex: 445; Ref Designator: R201; Symbol name: R-SXEM-1.1; SymIndex: 1; Part Name: RES 0.0 OHM 1/10W 0603 SMD; Part Number: ERJ-3GEY0R00V
R204 = RES 10.7 OHM 1/10W 1% 0603 SMD: ERJ-3EKF10R7V; Part Label: 10,7R; Cell Name: 0603-STANDART-1608; CmpIndex: 304; Ref Designator: R204; Symbol name: R-SXEM-1.1; SymIndex: 1; Part Name: RES 10.7 OHM 1/10W 1% 0603 SMD; Part Number: ERJ-3EKF10R7V
R205 = RES 10.7 OHM 1/10W 1% 0603 SMD: ERJ-3EKF10R7V; Part Label: 10,7R; Cell Name: 0603-STANDART-1608; CmpIndex: 428; Ref Designator: R205; Symbol name: R-SXEM-1.1; SymIndex: 1; Part Name: RES 10.7 OHM 1/10W 1% 0603 SMD; Part Number: ERJ-3EKF10R7V
R206 = RES 10.7 OHM 1/10W 1% 0603 SMD: ERJ-3EKF10R7V; Part Label: 10,7R; Cell Name: 0603-STANDART-1608; CmpIndex: 464; Ref Designator: R206; Symbol name: R-SXEM-1.1; SymIndex: 1; Part Name: RES 10.7 OHM 1/10W 1% 0603 SMD; Part Number: ERJ-3EKF10R7V
R207 = RES 10.2K OHM 1/10W 1% 0603 SMD: ERJ-3EKF1022V; Part Label: 10,2K; Cell Name: 0603-STANDART-1608; CmpIndex: 305; Ref Designator: R207; Symbol name: R-SXEM-1.1; SymIndex: 1; Part Name: RES 10.2K OHM 1/10W 1% 0603 SMD; Part Number: ERJ-3EKF1022V
R208 = RES 10.2K OHM 1/10W 1% 0603 SMD: ERJ-3EKF1022V; Part Label: 10,2K; Cell Name: 0603-STANDART-1608; CmpIndex: 308; Ref Designator: R208; Symbol name: R-SXEM-1.1; SymIndex: 1; Part Name: RES 10.2K OHM 1/10W 1% 0603 SMD; Part Number: ERJ-3EKF1022V
R209 = RES 10.2K OHM 1/10W 1% 0603 SMD: ERJ-3EKF1022V; Part Label: 10,2K; Cell Name: 0603-STANDART-1608; CmpIndex: 309; Ref Designator: R209; Symbol name: R-SXEM-1.1; SymIndex: 1; Part Name: RES 10.2K OHM 1/10W 1% 0603 SMD; Part Number: ERJ-3EKF1022V
R210 = RES 10.2K OHM 1/10W 1% 0603 SMD: ERJ-3EKF1022V; Part Label: 10,2K; Cell Name: 0603-STANDART-1608; CmpIndex: 310; Ref Designator: R210; Symbol name: R-SXEM-1.1; SymIndex: 1; Part Name: RES 10.2K OHM 1/10W 1% 0603 SMD; Part Number: ERJ-3EKF1022V
R211 = RES 10.2K OHM 1/10W 1% 0603 SMD: ERJ-3EKF1022V; Part Label: 10,2K; Cell Name: 0603-STANDART-1608; CmpIndex: 311; Ref Designator: R211; Symbol name: R-SXEM-1.1; SymIndex: 1; Part Name: RES 10.2K OHM 1/10W 1% 0603 SMD; Part Number: ERJ-3EKF1022V
R212 = RES 10.2K OHM 1/10W 1% 0603 SMD: ERJ-3EKF1022V; Part Label: 10,2K; Cell Name: 0603-STANDART-1608; CmpIndex: 320; Ref Designator: R212; Symbol name: R-SXEM-1.1; SymIndex: 1; Part Name: RES 10.2K OHM 1/10W 1% 0603 SMD; Part Number: ERJ-3EKF1022V
R213 = RES 10.2K OHM 1/10W 1% 0603 SMD: ERJ-3EKF1022V; Part Label: 10,2K; Cell Name: 0603-STANDART-1608; CmpIndex: 346; Ref Designator: R213; Symbol name: R-SXEM-1.1; SymIndex: 1; Part Name: RES 10.2K OHM 1/10W 1% 0603 SMD; Part Number: ERJ-3EKF1022V
R214 = RES 10.2K OHM 1/10W 1% 0603 SMD: ERJ-3EKF1022V; Part Label: 10,2K; Cell Name: 0603-STANDART-1608; CmpIndex: 347; Ref Designator: R214; Symbol name: R-SXEM-1.1; SymIndex: 1; Part Name: RES 10.2K OHM 1/10W 1% 0603 SMD; Part Number: ERJ-3EKF1022V
R215 = RES 10.2K OHM 1/10W 1% 0603 SMD: ERJ-3EKF1022V; Part Label: 10,2K; Cell Name: 0603-STANDART-1608; CmpIndex: 348; Ref Designator: R215; Symbol name: R-SXEM-1.1; SymIndex: 1; Part Name: RES 10.2K OHM 1/10W 1% 0603 SMD; Part Number: ERJ-3EKF1022V
R216 = RES 10.2K OHM 1/10W 1% 0603 SMD: ERJ-3EKF1022V; Part Label: 10,2K; Cell Name: 0603-STANDART-1608; CmpIndex: 353; Ref Designator: R216; Symbol name: R-SXEM-1.1; SymIndex: 1; Part Name: RES 10.2K OHM 1/10W 1% 0603 SMD; Part Number: ERJ-3EKF1022V
R217 = RES 10.2K OHM 1/10W 1% 0603 SMD: ERJ-3EKF1022V; Part Label: 10,2K; Cell Name: 0603-STANDART-1608; CmpIndex: 382; Ref Designator: R217; Symbol name: R-SXEM-1.1; SymIndex: 1; Part Name: RES 10.2K OHM 1/10W 1% 0603 SMD; Part Number: ERJ-3EKF1022V
R218 = RES 10.2K OHM 1/10W 1% 0603 SMD: ERJ-3EKF1022V; Part Label: 10,2K; Cell Name: 0603-STANDART-1608; CmpIndex: 429; Ref Designator: R218; Symbol name: R-SXEM-1.1; SymIndex: 1; Part Name: RES 10.2K OHM 1/10W 1% 0603 SMD; Part Number: ERJ-3EKF1022V
R219 = RES 10.2K OHM 1/10W 1% 0603 SMD: ERJ-3EKF1022V; Part Label: 10,2K; Cell Name: 0603-STANDART-1608; CmpIndex: 432; Ref Designator: R219; Symbol name: R-SXEM-1.1; SymIndex: 1; Part Name: RES 10.2K OHM 1/10W 1% 0603 SMD; Part Number: ERJ-3EKF1022V
R220 = RES 10.2K OHM 1/10W 1% 0603 SMD: ERJ-3EKF1022V; Part Label: 10,2K; Cell Name: 0603-STANDART-1608; CmpIndex: 435; Ref Designator: R220; Symbol name: R-SXEM-1.1; SymIndex: 1; Part Name: RES 10.2K OHM 1/10W 1% 0603 SMD; Part Number: ERJ-3EKF1022V
R221 = RES 10.2K OHM 1/10W 1% 0603 SMD: ERJ-3EKF1022V; Part Label: 10,2K; Cell Name: 0603-STANDART-1608; CmpIndex: 436; Ref Designator: R221; Symbol name: R-SXEM-1.1; SymIndex: 1; Part Name: RES 10.2K OHM 1/10W 1% 0603 SMD; Part Number: ERJ-3EKF1022V
R222 = RES 10.2K OHM 1/10W 1% 0603 SMD: ERJ-3EKF1022V; Part Label: 10,2K; Cell Name: 0603-STANDART-1608; CmpIndex: 437; Ref Designator: R222; Symbol name: R-SXEM-1.1; SymIndex: 1; Part Name: RES 10.2K OHM 1/10W 1% 0603 SMD; Part Number: ERJ-3EKF1022V
R223 = RES 10.2K OHM 1/10W 1% 0603 SMD: ERJ-3EKF1022V; Part Label: 10,2K; Cell Name: 0603-STANDART-1608; CmpIndex: 438; Ref Designator: R223; Symbol name: R-SXEM-1.1; SymIndex: 1; Part Name: RES 10.2K OHM 1/10W 1% 0603 SMD; Part Number: ERJ-3EKF1022V
R224 = RES 10.2K OHM 1/10W 1% 0603 SMD: ERJ-3EKF1022V; Part Label: 10,2K; Cell Name: 0603-STANDART-1608; CmpIndex: 439; Ref Designator: R224; Symbol name: R-SXEM-1.1; SymIndex: 1; Part Name: RES 10.2K OHM 1/10W 1% 0603 SMD; Part Number: ERJ-3EKF1022V
R225 = RES 10.2K OHM 1/10W 1% 0603 SMD: ERJ-3EKF1022V; Part Label: 10,2K; Cell Name: 0603-STANDART-1608; CmpIndex: 440; Ref Designator: R225; Symbol name: R-SXEM-1.1; SymIndex: 1; Part Name: RES 10.2K OHM 1/10W 1% 0603 SMD; Part Number: ERJ-3EKF1022V
R226 = RES 20.5K OHM 1/10W 1% 0603 SMD: ERJ-3EKF2052V; Part Label: 20,5K; Cell Name: 0603-STANDART-1608; CmpIndex: 306; Ref Designator: R226; Symbol name: R-SXEM-1.1; SymIndex: 1; Part Name: RES 20.5K OHM 1/10W 1% 0603 SMD; Part Number: ERJ-3EKF2052V
R227 = RES 20.5K OHM 1/10W 1% 0603 SMD: ERJ-3EKF2052V; Part Label: 20,5K; Cell Name: 0603-STANDART-1608; CmpIndex: 312; Ref Designator: R227; Symbol name: R-SXEM-1.1; SymIndex: 1; Part Name: RES 20.5K OHM 1/10W 1% 0603 SMD; Part Number: ERJ-3EKF2052V
R228 = RES 20.5K OHM 1/10W 1% 0603 SMD: ERJ-3EKF2052V; Part Label: 20,5K; Cell Name: 0603-STANDART-1608; CmpIndex: 319; Ref Designator: R228; Symbol name: R-SXEM-1.1; SymIndex: 1; Part Name: RES 20.5K OHM 1/10W 1% 0603 SMD; Part Number: ERJ-3EKF2052V
R229 = RES 20.5K OHM 1/10W 1% 0603 SMD: ERJ-3EKF2052V; Part Label: 20,5K; Cell Name: 0603-STANDART-1608; CmpIndex: 349; Ref Designator: R229; Symbol name: R-SXEM-1.1; SymIndex: 1; Part Name: RES 20.5K OHM 1/10W 1% 0603 SMD; Part Number: ERJ-3EKF2052V
R230 = RES 20.5K OHM 1/10W 1% 0603 SMD: ERJ-3EKF2052V; Part Label: 20,5K; Cell Name: 0603-STANDART-1608; CmpIndex: 425; Ref Designator: R230; Symbol name: R-SXEM-1.1; SymIndex: 1; Part Name: RES 20.5K OHM 1/10W 1% 0603 SMD; Part Number: ERJ-3EKF2052V
R231 = RES 20.5K OHM 1/10W 1% 0603 SMD: ERJ-3EKF2052V; Part Label: 20,5K; Cell Name: 0603-STANDART-1608; CmpIndex: 495; Ref Designator: R231; Symbol name: R-SXEM-1.1; SymIndex: 1; Part Name: RES 20.5K OHM 1/10W 1% 0603 SMD; Part Number: ERJ-3EKF2052V
R232 = RES 20.5K OHM 1/10W 1% 0603 SMD: ERJ-3EKF2052V; Part Label: 20,5K; Cell Name: 0603-STANDART-1608; CmpIndex: 547; Ref Designator: R232; Symbol name: R-SXEM-1.1; SymIndex: 1; Part Name: RES 20.5K OHM 1/10W 1% 0603 SMD; Part Number: ERJ-3EKF2052V
R233 = RES 20.5K OHM 1/10W 1% 0603 SMD: ERJ-3EKF2052V; Part Label: 20,5K; Cell Name: 0603-STANDART-1608; CmpIndex: 806; Ref Designator: R233; Symbol name: R-SXEM-1.1; SymIndex: 1; Part Name: RES 20.5K OHM 1/10W 1% 0603 SMD; Part Number: ERJ-3EKF2052V
R234 = RES 22.0K OHM 1W 5% 2512 SMD: CRCW251222K0JNEG; Part Label: 22K; Cell Name: 2512-STANDART-6332; CmpIndex: 374; Ref Designator: R234; Symbol name: R-SXEM-1.1; SymIndex: 1; Part Name: RES 22.0K OHM 1W 5% 2512 SMD; Part Number: CRCW251222K0JNEG
R235 = RES 22.0K OHM 1W 5% 2512 SMD: CRCW251222K0JNEG; Part Label: 22K; Cell Name: 2512-STANDART-6332; CmpIndex: 375; Ref Designator: R235; Symbol name: R-SXEM-1.1; SymIndex: 1; Part Name: RES 22.0K OHM 1W 5% 2512 SMD; Part Number: CRCW251222K0JNEG
R236 = RES 22.0K OHM 1W 5% 2512 SMD: CRCW251222K0JNEG; Part Label: 22K; Cell Name: 2512-STANDART-6332; CmpIndex: 376; Ref Designator: R236; Symbol name: R-SXEM-1.1; SymIndex: 1; Part Name: RES 22.0K OHM 1W 5% 2512 SMD; Part Number: CRCW251222K0JNEG
R237 = RES 22.0K OHM 1W 5% 2512 SMD: CRCW251222K0JNEG; Part Label: 22K; Cell Name: 2512-STANDART-6332; CmpIndex: 377; Ref Designator: R237; Symbol name: R-SXEM-1.1; SymIndex: 1; Part Name: RES 22.0K OHM 1W 5% 2512 SMD; Part Number: CRCW251222K0JNEG
R238 = RES 22.0K OHM 1W 5% 2512 SMD: CRCW251222K0JNEG; Part Label: 22K; Cell Name: 2512-STANDART-6332; CmpIndex: 378; Ref Designator: R238; Symbol name: R-SXEM-1.1; SymIndex: 1; Part Name: RES 22.0K OHM 1W 5% 2512 SMD; Part Number: CRCW251222K0JNEG
R239 = RES 51.1 OHM 1/2W 1% 1210 SMD: ERJ-14NF51R1U; Part Label: 51,1R; Cell Name: 1210-STANDART-3225; CmpIndex: 380; Ref Designator: R239; Symbol name: R-SXEM-1.1; SymIndex: 1; Part Name: RES 51.1 OHM 1/2W 1% 1210 SMD; Part Number: ERJ-14NF51R1U
R240 = RES 340K OHM 1/10W 1% 0603 SMD: ERJ-3EKF3403V; Cell Name: 0603-STANDART-1608; CmpIndex: 391; Ref Designator: R240; Symbol name: R-SXEM-1.1; SymIndex: 1; Part Label: 340K; Part Name: RES 340K OHM 1/10W 1% 0603 SMD; Part Number: ERJ-3EKF3403V
R241 = RES 340K OHM 1/10W 1% 0603 SMD: ERJ-3EKF3403V; Cell Name: 0603-STANDART-1608; CmpIndex: 402; Ref Designator: R241; Symbol name: R-SXEM-1.1; SymIndex: 1; Part Label: 340K; Part Name: RES 340K OHM 1/10W 1% 0603 SMD; Part Number: ERJ-3EKF3403V
R247 = RES 10.0 OHM 1/10W 1% 0603 SMD: ERJ-3EKF10R0V; Part Label: 10R; Cell Name: 0603-STANDART-1608; CmpIndex: 405; Ref Designator: R247; Symbol name: R-SXEM-1.1; SymIndex: 1; Part Name: RES 10.0 OHM 1/10W 1% 0603 SMD; Part Number: ERJ-3EKF10R0V
R248 = RES 10.0 OHM 1/10W 1% 0603 SMD: ERJ-3EKF10R0V; Part Label: 10R; Cell Name: 0603-STANDART-1608; CmpIndex: 409; Ref Designator: R248; Symbol name: R-SXEM-1.1; SymIndex: 1; Part Name: RES 10.0 OHM 1/10W 1% 0603 SMD; Part Number: ERJ-3EKF10R0V
R249 = RES 10.0 OHM 1/10W 1% 0603 SMD: ERJ-3EKF10R0V; Part Label: 10R; Cell Name: 0603-STANDART-1608; CmpIndex: 410; Ref Designator: R249; Symbol name: R-SXEM-1.1; SymIndex: 1; Part Name: RES 10.0 OHM 1/10W 1% 0603 SMD; Part Number: ERJ-3EKF10R0V
R250 = RES 10.0 OHM 1/10W 1% 0603 SMD: ERJ-3EKF10R0V; Part Label: 10R; Cell Name: 0603-STANDART-1608; CmpIndex: 411; Ref Designator: R250; Symbol name: R-SXEM-1.1; SymIndex: 1; Part Name: RES 10.0 OHM 1/10W 1% 0603 SMD; Part Number: ERJ-3EKF10R0V
R251 = RES 10.0 OHM 1/10W 1% 0603 SMD: ERJ-3EKF10R0V; Part Label: 10R; Cell Name: 0603-STANDART-1608; CmpIndex: 412; Ref Designator: R251; Symbol name: R-SXEM-1.1; SymIndex: 1; Part Name: RES 10.0 OHM 1/10W 1% 0603 SMD; Part Number: ERJ-3EKF10R0V
R252 = RES 10.0 OHM 1/10W 1% 0603 SMD: ERJ-3EKF10R0V; Part Label: 10R; Cell Name: 0603-STANDART-1608; CmpIndex: 413; Ref Designator: R252; Symbol name: R-SXEM-1.1; SymIndex: 1; Part Name: RES 10.0 OHM 1/10W 1% 0603 SMD; Part Number: ERJ-3EKF10R0V
R253 = RES 210 OHM 1/10W 1% 0603 SMD: ERJ-3EKF2100V; Part Label: 210R; Cell Name: 0603-STANDART-1608; CmpIndex: 483; Ref Designator: R253; Symbol name: R-SXEM-1.1; SymIndex: 1; Part Name: RES 210 OHM 1/10W 1% 0603 SMD; Part Number: ERJ-3EKF2100V
R254 = RES 210 OHM 1/10W 1% 0603 SMD: ERJ-3EKF2100V; Part Label: 210R; Cell Name: 0603-STANDART-1608; CmpIndex: 494; Ref Designator: R254; Symbol name: R-SXEM-1.1; SymIndex: 1; Part Name: RES 210 OHM 1/10W 1% 0603 SMD; Part Number: ERJ-3EKF2100V
R255 = RES 53.6K OHM 1/10W 1% 0603 SMD: ERJ-3EKF5362V; Part Label: 53,6K; Cell Name: 0603-STANDART-1608; CmpIndex: 542; Ref Designator: R255; Symbol name: R-SXEM-1.1; SymIndex: 1; Part Name: RES 53.6K OHM 1/10W 1% 0603 SMD; Part Number: ERJ-3EKF5362V
R256 = RES 53.6K OHM 1/10W 1% 0603 SMD: ERJ-3EKF5362V; Part Label: 53,6K; Cell Name: 0603-STANDART-1608; CmpIndex: 546; Ref Designator: R256; Symbol name: R-SXEM-1.1; SymIndex: 1; Part Name: RES 53.6K OHM 1/10W 1% 0603 SMD; Part Number: ERJ-3EKF5362V
V8 = DIODE SWITCH 100V 0.15A SOD123: 1N4148W-7-F; Part Label: 100V/0,15A; Cell Name: SOD123-DIODES; CmpIndex: 293; Ref Designator: V8; Symbol name: DIODE-SXEM-1.1; SymIndex: 18; Part Name: DIODE SWITCH 100V 0.15A SOD123; Part Number: 1N4148W-7-F
V9 = DIODE SWITCH 100V 0.15A SOD123: 1N4148W-7-F; Part Label: 100V/0,15A; Cell Name: SOD123-DIODES; CmpIndex: 294; Ref Designator: V9; Symbol name: DIODE-SXEM-1.1; SymIndex: 18; Part Name: DIODE SWITCH 100V 0.15A SOD123; Part Number: 1N4148W-7-F
V10 = DIODE SWITCH 100V 0.15A SOD123: 1N4148W-7-F; Part Label: 100V/0,15A; Cell Name: SOD123-DIODES; CmpIndex: 496; Ref Designator: V10; Symbol name: DIODE-SXEM-1.1; SymIndex: 18; Part Name: DIODE SWITCH 100V 0.15A SOD123; Part Number: 1N4148W-7-F
V11 = DIODE SWITCH 100V 0.15A SOD123: 1N4148W-7-F; Part Label: 100V/0,15A; Cell Name: SOD123-DIODES; CmpIndex: 535; Ref Designator: V11; Symbol name: DIODE-SXEM-1.1; SymIndex: 18; Part Name: DIODE SWITCH 100V 0.15A SOD123; Part Number: 1N4148W-7-F